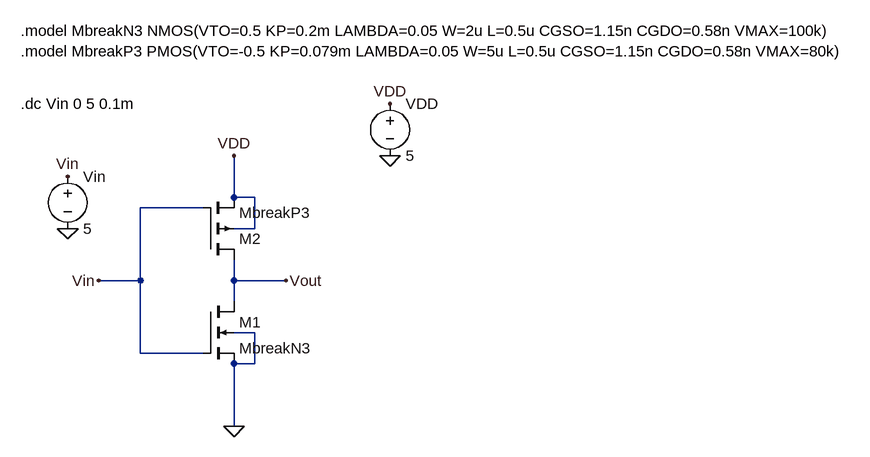
[diagram p0: schematic 3.asc]
3.asc, the LTspice schematic file:
Version 4.1
SHEET 1 1344 680
WIRE 320 208 320 144
WIRE 352 208 320 208
WIRE 272 224 176 224
WIRE 352 256 352 208
WIRE 352 256 320 256
WIRE 176 336 176 224
WIRE 176 336 112 336
WIRE 320 336 320 304
WIRE 400 336 320 336
WIRE 320 368 320 336
WIRE 352 416 320 416
WIRE 176 448 176 336
WIRE 272 448 176 448
WIRE 352 464 352 416
WIRE 352 464 320 464
WIRE 320 560 320 464
FLAG 320 560 0
FLAG 560 144 0
FLAG 560 64 VDD
FLAG 320 144 VDD
FLAG 64 256 0
FLAG 64 176 Vin
FLAG 112 336 Vin
FLAG 400 336 Vout
SYMBOL nmos4 272 368 R0
SYMATTR InstName M1
SYMATTR Value MbreakN3
SYMATTR Value2 l=0.5u w=2u
SYMBOL pmos4 272 304 M180
SYMATTR InstName M2
SYMATTR Value MbreakP3
SYMATTR Value2 l=0.5u w=5u
SYMBOL voltage 560 48 R0
WINDOW 123 0 0 Left 0
WINDOW 39 0 0 Left 0
SYMATTR InstName VDD
SYMATTR Value 5
SYMBOL voltage 64 160 R0
WINDOW 123 0 0 Left 0
WINDOW 39 0 0 Left 0
SYMATTR InstName Vin
SYMATTR Value 5
TEXT -8 -48 Left 2 !.model MbreakN3 NMOS(VTO=0.5 KP=0.2m LAMBDA=0.05 W=2u L=0.5u CGSO=1.15n CGDO=0.58n VMAX=100k)\n.model MbreakP3 PMOS(VTO=-0.5 KP=0.079m LAMBDA=0.05 W=5u L=0.5u CGSO=1.15n CGDO=0.58n VMAX=80k)
TEXT -8 64 Left 2 !.dc Vin 0 5 0.1m

The netlist it stands for:
* 3.asc
M1 Vout Vin 0 0 MbreakN3 l=0.5u w=2u
M2 Vout Vin VDD VDD MbreakP3 l=0.5u w=5u
VDD VDD 0 5
Vin Vin 0 5
.model NMOS NMOS
.model PMOS PMOS
.lib standard.mos
.model MbreakN3 NMOS(VTO=0.5 KP=0.2m LAMBDA=0.05 W=2u L=0.5u CGSO=1.15n CGDO=0.58n VMAX=100k)
.model MbreakP3 PMOS(VTO=-0.5 KP=0.079m LAMBDA=0.05 W=5u L=0.5u CGSO=1.15n CGDO=0.58n VMAX=80k)
.dc Vin 0 5 0.1m
.backanno
.end